# Altium project Grantiot.PrjPcb (part 1 of 2)
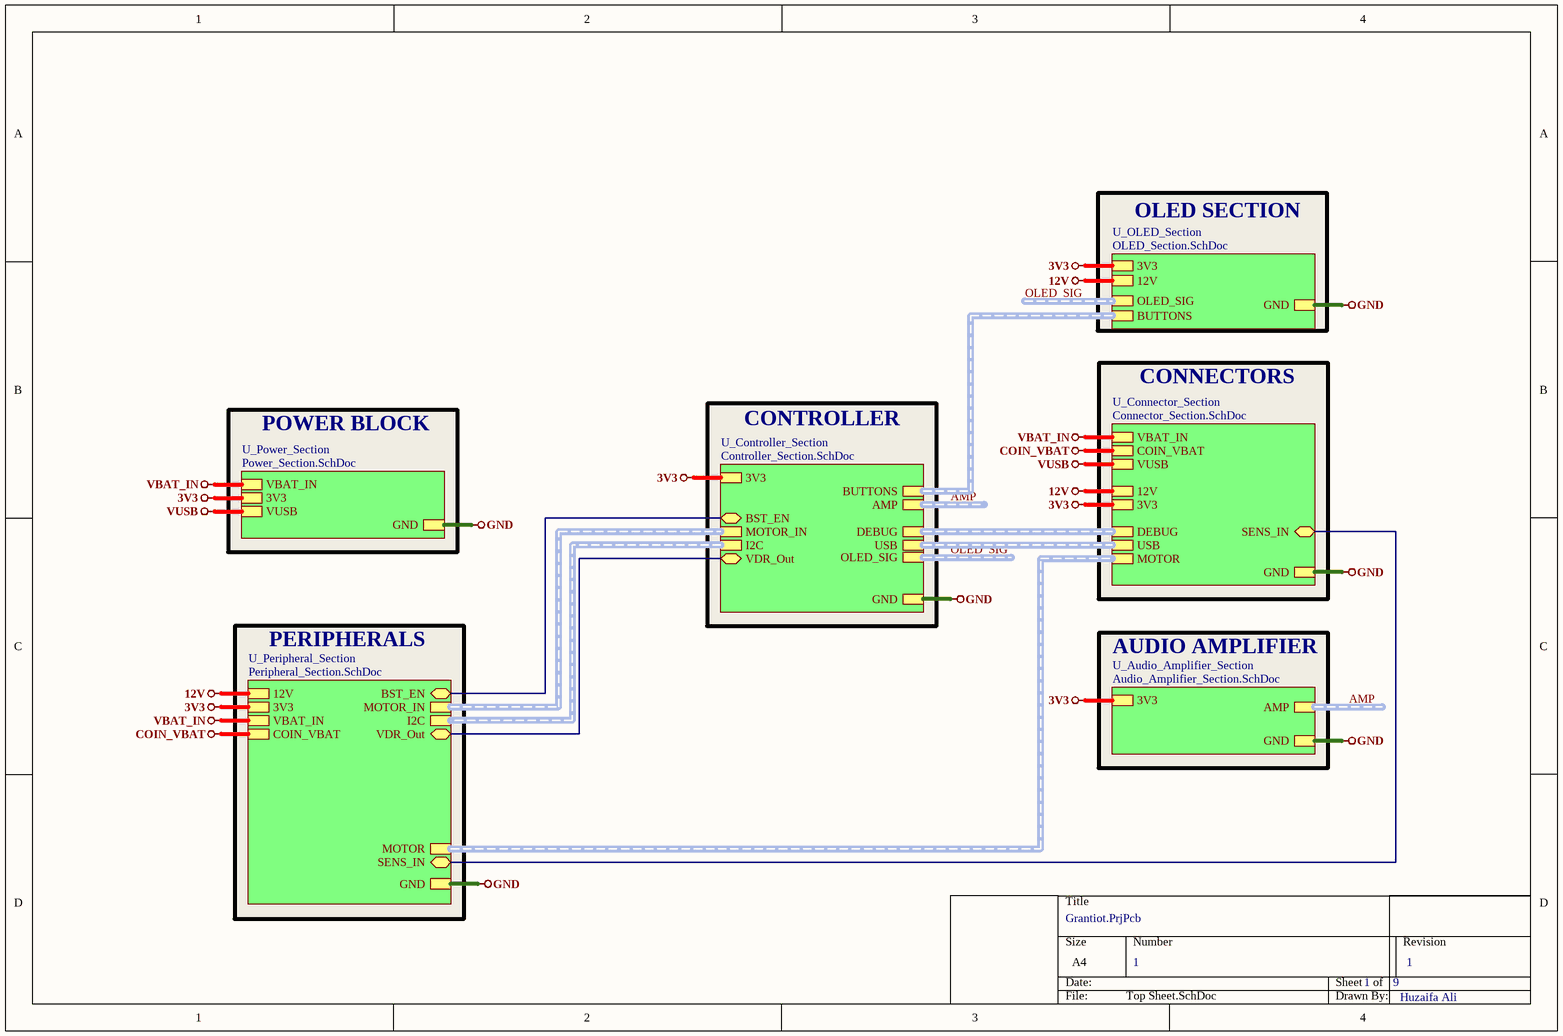
[diagram p0: Top Sheet.SchDoc]
7 sheets, 97 parts. Net scope: hierarchical (ports join the sheet entries above them; power ports are global).
Board file: Grantv3.PcbDoc
Sheets:
  Top Sheet.SchDoc
    U_Power_Section = Power_Section.SchDoc
    U_Peripheral_Section = Peripheral_Section.SchDoc
    U_Controller_Section = Controller_Section.SchDoc
    U_Connector_Section = Connector_Section.SchDoc
    U_Audio_Amplifier_Section = Audio_Amplifier_Section.SchDoc
    U_OLED_Section = OLED_Section.SchDoc

## Sheet Top Sheet.SchDoc
size A4; DocumentNumber: 1; SheetNumber: 1; SheetTotal: 9

### Sub-sheets
U_Audio_Amplifier_Section = Audio_Amplifier_Section.SchDoc: 3V3, GND, AMP (harness AMP)
U_Connector_Section = Connector_Section.SchDoc: SENS_IN (bidir), DEBUG (harness DEBUG), USB (harness USB), MOTOR (harness MOTOR), 12V, 3V3, GND, VBAT_IN, COIN_VBAT, VUSB
U_Controller_Section = Controller_Section.SchDoc: VDR_Out (bidir), USB (harness USB), DEBUG (harness DEBUG), I2C (harness I2C), MOTOR_IN (harness MOTOR_IN), 3V3, GND, BST_EN (bidir), AMP (harness AMP), OLED_SIG (harness OLED_SIG), BUTTONS (harness BUTTONS)
U_OLED_Section = OLED_Section.SchDoc: OLED_SIG (harness OLED_SIG), 12V, 3V3, GND, BUTTONS (harness BUTTONS)
U_Peripheral_Section = Peripheral_Section.SchDoc: BST_EN (bidir), SENS_IN (bidir), VDR_Out (bidir), MOTOR (harness MOTOR), I2C (harness I2C), MOTOR_IN (harness MOTOR_IN), 12V, 3V3, GND, VBAT_IN, COIN_VBAT
U_Power_Section = Power_Section.SchDoc: VBAT_IN, 3V3, GND, VUSB

### Nets
3V3: sheet U_Power_Section/3V3, sheet U_Peripheral_Section/3V3, sheet U_Controller_Section/3V3, sheet U_Connector_Section/3V3, sheet U_Audio_Amplifier_Section/3V3, sheet U_OLED_Section/3V3
12V: sheet U_Peripheral_Section/12V, sheet U_Connector_Section/12V, sheet U_OLED_Section/12V
COIN_VBAT: sheet U_Peripheral_Section/COIN_VBAT, sheet U_Connector_Section/COIN_VBAT
GND: sheet U_Power_Section/GND, sheet U_Peripheral_Section/GND, sheet U_Controller_Section/GND, sheet U_Connector_Section/GND, sheet U_Audio_Amplifier_Section/GND, sheet U_OLED_Section/GND
VBAT_IN: sheet U_Power_Section/VBAT_IN, sheet U_Peripheral_Section/VBAT_IN, sheet U_Connector_Section/VBAT_IN  [project net 3V3ZD]
VUSB: sheet U_Power_Section/VUSB, sheet U_Connector_Section/VUSB  [project net VSUB]
BST_EN: sheet U_Peripheral_Section/BST_EN, sheet U_Controller_Section/BST_EN
SENS_IN: sheet U_Peripheral_Section/SENS_IN, sheet U_Connector_Section/SENS_IN
VDR_Out: sheet U_Peripheral_Section/VDR_Out, sheet U_Controller_Section/VDR_Out

### Buses and harness runs
harness AMP = sheet U_Audio_Amplifier_Section/AMP
harness AMP = sheet U_Controller_Section/AMP
harness OLED_SIG = sheet U_Controller_Section/OLED_SIG
harness OLED_SIG = sheet U_OLED_Section/OLED_SIG
harness sheet U_Connector_Section/DEBUG = sheet U_Controller_Section/DEBUG
harness sheet U_Connector_Section/MOTOR = sheet U_Peripheral_Section/MOTOR
harness sheet U_Connector_Section/USB = sheet U_Controller_Section/USB
harness sheet U_Controller_Section/BUTTONS = sheet U_OLED_Section/BUTTONS
harness sheet U_Controller_Section/I2C = sheet U_Peripheral_Section/I2C
harness sheet U_Controller_Section/MOTOR_IN = sheet U_Peripheral_Section/MOTOR_IN

### Notes on the sheet
- OLED SECTION
- CONNECTORS
- POWER BLOCK
- CONTROLLER
- PERIPHERALS
- AUDIO AMPLIFIER
- 1
- Huzaifa Ali

## Sheet Power_Section.SchDoc
size A4; DocumentNumber: 2; SheetNumber: 2; SheetTotal: 9
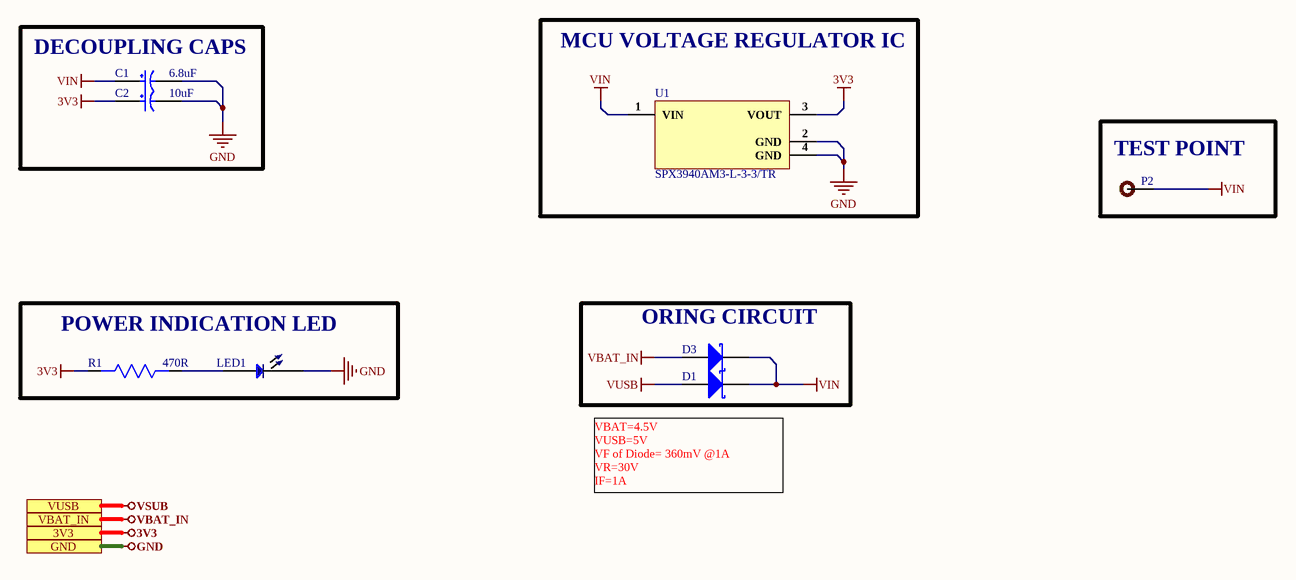
[diagram p1: Power_Section.SchDoc]

### Parts
C1  6.8uF  [EEEHB1E6R8R]
C2  10uF  [RVT1E100M0405]
D1  PMEG3010ER,115  [SOD123W]  (value not drawn)
D3  PMEG3010ER,115  [SOD123W]  (value not drawn)
LED1  TJ-S1005SW4TGLC2R-A5  [LED 0402]  (value not drawn)
P2  TEST POINT  [TEST POINT]  (value not drawn)
R1  470R  [Res0402]
U1  SPX3940AM3-L-3-3/TR  [SPX3940AM3-L-3-3/TR]

### Blocks framed on the sheet
DECOUPLING CAPS: C1 C2
MCU VOLTAGE REGULATOR IC: U1
TEST POINT: P2
POWER INDICATION LED: LED1 R1
ORING CIRCUIT: D1 D3

### Ports
3V3, GND, VBAT_IN, VUSB

### Nets
3V3: C2.1 R1.2 U1.3(VOUT) ; port 3V3
GND: C1.2 C2.2 LED1.2 U1.2(GND) U1.4(GND) ; port GND
VBAT_IN: D3.A ; port VBAT_IN  [project net 3V3ZD]
VIN: C1.1 D1.K D3.K P2.1 U1.1(VIN)
VSUB: D1.A ; port VUSB  [also labelled VUSB]
NetLED1_1: LED1.1 R1.1

### Notes on the sheet
- (near D1) VBAT=4.5V
  VUSB=5V
  VF of Diode= 360mV @1A
  VR=30V
  IF=1A
- 1
- Huzaifa Ali

### Library data of the parts
C1 = EEEHB1E6R8R: CAP ALUM 6.8UF 20% 25V SMD; Manufacturer: Panasonic; Manufacturer Part Number: EEE-HB1E6R8R; Ripple Current: 25mA; Polarity: Polar; Life (Hours): 2000Hour; Leakage Current: 3uA; Supplier 1: Digi-Key; RoHS: Yes; Category: Aluminum Electrolytic Capacitors; Stock 1: 1546; Pricing 1: 1=0.43000, 10=0.29300, 50=0.19560, 100=0.16620, 500=0.11730, 1000=0.10264 (USD); Mount: Surface Mount,PCB; Case/Package: Radial; Min Operating Temperature: -40°C; Max Operating Temperature: 105°C; Capacitance: 6.8uF; Tolerance: 20%; Voltage Rating: 25V; Ripple Current (AC): 25mA; Packaging: Tape and Reel; Voltage Rating (DC): 25V; Package Quantity: 2000; Termination: SMD/SMT; Voltage: 25V; Series: HB; Construction: Cylindrical; Diameter: 4mm; Length: 5.5mm; Width: 650um; Height: 5.8mm; Height - Seated (Max): 0.228inch; Radiation Hardening: No; REACH SVHC: Unknown; Lead Free: Lead Free; RoHS Compliant: Yes; ComponentLink1URL: https://datasheet.ciiva.com/11784/0900766b806bc524-11784635.pdf?src-supplier=RSComponents; ComponentLink1Description: https://datasheet.ciiva.com/11784/0900766b806bc524-11784635.pdf?src-supplier=RSComponents; ComponentLink2URL: https://datasheet.ciiva.com/7903/1790623-7903207.pdf?src-supplier=Element14; ComponentLink2Description: https://datasheet.ciiva.com/7903/1790623-7903207.pdf?src-supplier=Element14; ComponentLink3URL: https://datasheet.ciiva.com/14592/70068251-14592830.pdf?src-supplier=Allied+Electronics; ComponentLink3Description: https://datasheet.ciiva.com/14592/70068251-14592830.pdf?src-supplier=Allied+Electronics; ComponentLink4URL: https://datasheet.ciiva.com/14596/70068251-14596488.pdf?src-supplier=Allied+Electronics; ComponentLink4Description: https://datasheet.ciiva.com/14596/70068251-14596488.pdf?src-supplier=Allied+Electronics; ComponentLink5URL: https://datasheet.ciiva.com/11681/aba0000ce4-11681133.pdf?src-supplier=Avnet; ComponentLink5Description: https://datasheet.ciiva.com/11681/aba0000ce4-11681133.pdf?src-supplier=Avnet; ComponentLink6URL: https://datasheet.ciiva.com/30226/16aba0000ce4-30226095.pdf?src-supplier=Onlinecomponents.com; ComponentLink6Description: https://datasheet.ciiva.com/30226/16aba0000ce4-30226095.pdf?src-supplier=Onlinecomponents.com; Supplier Part Number 1: PCE4142CT-ND
C2 = RVT1E100M0405: CAP ALUM 10uF 25V SMD; Manufacturer: ROQANG; φD: 4mm; L: 5.4mm; Tolerance: ±20%; Operating Temperature: -45℃~+105℃; Rated Voltage: 25V; Capacitance: 10uF
D1 D3 = PMEG3010ER,115: DIODE SCHOTTKY 30V 1A SOD123W; Manufacturer: Nexperia; Supplier 1: Digi-Key; Manufacturer Part Number: PMEG3010ER,115; Stock 1: 75070; Pricing 1: 1=0.36, 10=0.29, 100=0.1669, 500=0.1545, 1000=0.10506 (USD); Supplier Part Number 1: 1727-5201-1-ND
LED1 = TJ-S1005SW4TGLC2R-A5: Red 625nm 0402 Light Emitting Diodes (LED) RoHS; Manufacturer: TOGIALED; Manufacturer Part No: TJ-S1005SW4TGLC2R-A5; Package: 0402
P2 = TEST POINT: Test Point ON
R1 = RTT02471JTH: 470 ±5% 1/16W ±100ppm/°C 0402 Chip Resistor - Surface Mount RoHS; Manufacturer: RALEC; Manufacturer Part No: RTT02471JTH; Package: 0402; Value: 470R
U1 = SPX3940AM3-L-3-3/TR: IC REG LDO 3.3V 1A SOT223; Manufacturer: Exar; Max Input Voltage: 16V; Dropout Voltage: 280mV; Number of Outputs: 1; Min Input Voltage: 3.1V; Polarity: Positive; Quiescent Current: 25mA; Output Voltage Accuracy: 1%; Supplier 1: Mouser; Manufacturer Part Number: SPX3940AM3-L-3-3/TR; RoHS: Yes; Category: Voltage Regulators - Linear; Mount: Surface Mount; Case/Package: SOT-223; Number of Pins: 4; Min Operating Temperature: -40°C; Max Operating Temperature: 125°C; Packaging: Tape and Reel; Output Current: 1A; Max Output Current: 1A; Output Voltage: 3.3V; Min Output Voltage: 3.3V; RoHS Compliant: Yes; Lead Free: Lead Free; ComponentLink1URL: https://datasheet.ciiva.com/2057/spx3940-ds-r100-022912-2057339.pdf?src-supplier=Digi-Key; ComponentLink1Description: https://datasheet.ciiva.com/2057/spx3940-ds-r100-022912-2057339.pdf?src-supplier=Digi-Key; ComponentLink2URL: https://datasheet.ciiva.com/16386/spx3940-series-16386634.pdf?src-supplier=Future+Electronics; ComponentLink2Description: https://datasheet.ciiva.com/16386/spx3940-series-16386634.pdf?src-supplier=Future+Electronics; Supplier Part Number 1: 701-SPX3940AM3-L33TR

## Sheet Peripheral_Section.SchDoc
size A4; DocumentNumber: 6; SheetNumber: 6; SheetTotal: 9
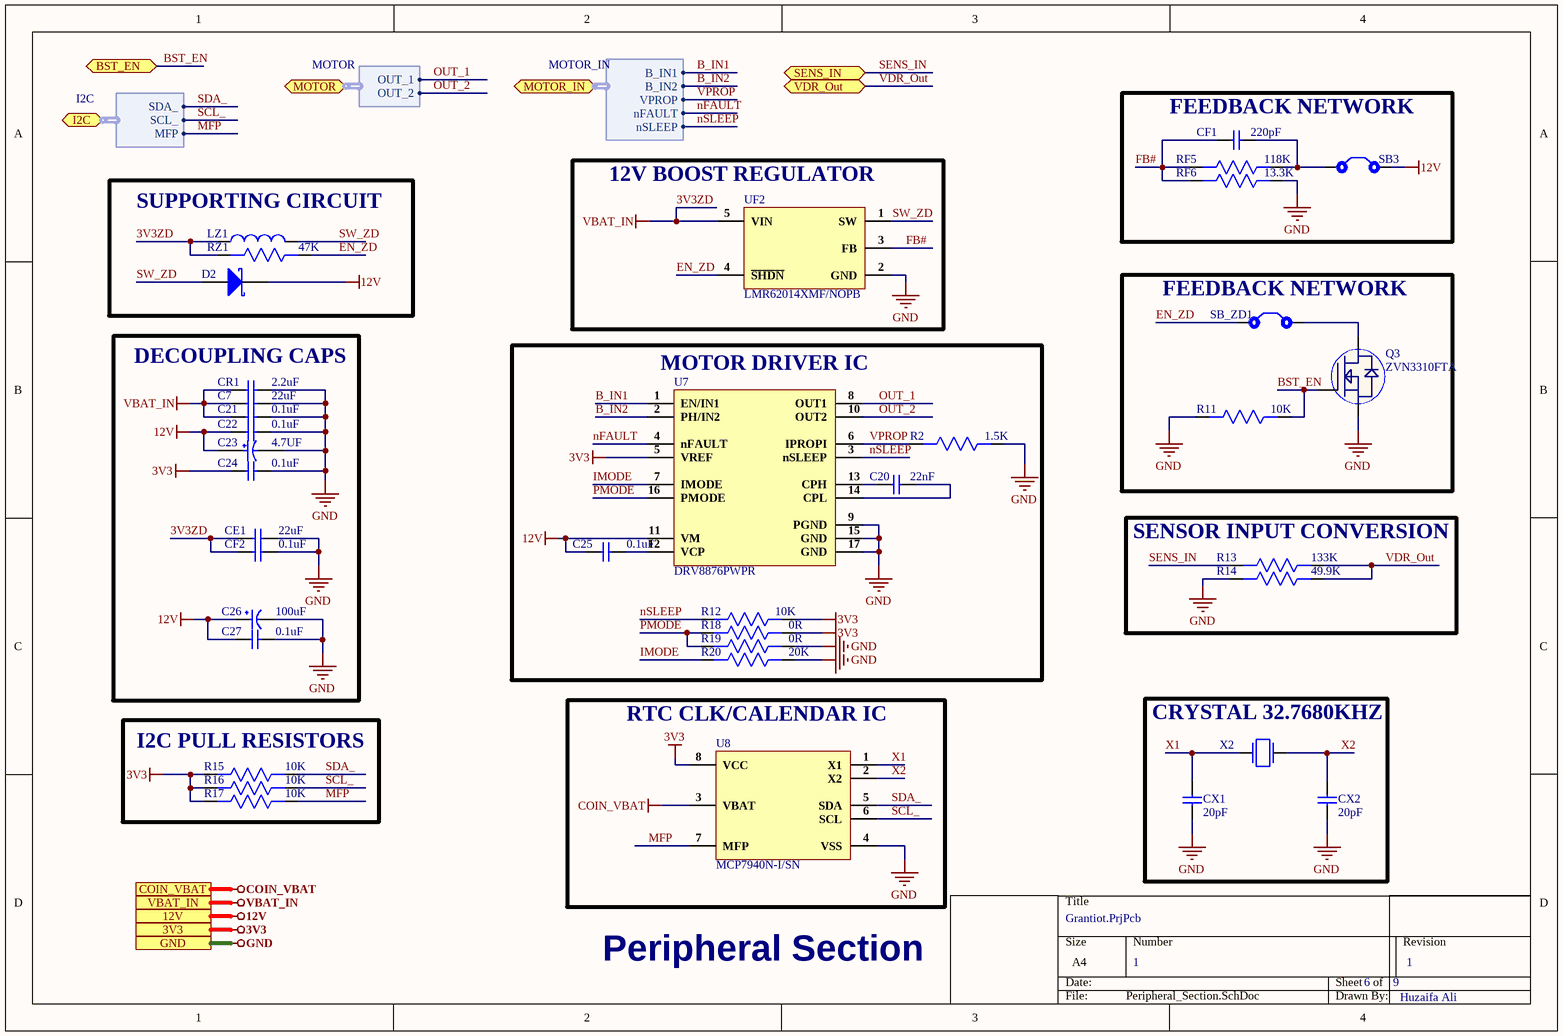
[diagram p2: Peripheral_Section.SchDoc]

### Parts
C7  22uF  [Cap0805]
C20  22nF  [Cap 0603]
C21  0.1uF  [Cap 0402]
C22  0.1uF  [Cap 0402]
C23  4.7UF  [TAJB475K035RNJ]
C24  0.1uF  [Cap 0402]
C25  0.1uF  [Cap 0402]
C26  100uF  [UWX1E101MCL1GB]
C27  0.1uF  [Cap 0402]
CE1  22uF  [Cap0805]
CF1  220pF  [Cap 0402]
CF2  0.1uF  [Cap 0402]
CR1  2.2uF  [Cap 0402]
CX1  20pF  [Cap 0201]
CX2  20pF  [Cap 0201]
D2  RB060M-30TR  [SOD-123F]  (value not drawn)
LZ1  MS0420-100M  [MS0420-100M]  (value not drawn)
Q3  ZVN3310FTA  [SOT23-3]
R2  1.5K  [Res-0201]
R11  10K  [Res0402]
R12  10K  [Res0402]
R13  133K  [Res0402]
R14  49.9K  [Res0402]
R15  10K  [Res0402]
R16  10K  [Res0402]
R17  10K  [Res0402]
R18  0R  [Res0402]
R19  0R  [Res0402]
R20  20K  [Res0402]
RF5  118K  [Res0402]
RF6  13.3K  [Res0402]
RZ1  47K  [Res0402]
SB3  Solder Bridge  [Solder Bridge]  (value not drawn)
SB_ZD1  Solder Bridge  [Solder Bridge]  (value not drawn)
U7  DRV8876PWPR  [16HTSSOP]
U8  MCP7940N-I/SN  [MCP7940N-I/SN]
UF2  LMR62014XMF/NOPB  [SOT23-5]
X2  NX3215SA-32.768K-STD-MUA-8  [NX3215SA-32.768K-STD-MUA-8]  (value not drawn)

### Blocks framed on the sheet
FEEDBACK NETWORK: CF1 RF5 RF6 SB3
SUPPORTING CIRCUIT: D2 LZ1 RZ1
12V BOOST REGULATOR: UF2
FEEDBACK NETWORK: Q3 R11 SB_ZD1
DECOUPLING CAPS: C7 C21-C24 C26 C27 CE1 CF2 CR1
MOTOR DRIVER IC: C20 C25 R2 R12 R18-R20 U7
SENSOR INPUT CONVERSION: R13 R14
I2C PULL RESISTORS: R15-R17
RTC CLK/CALENDAR IC: U8
CRYSTAL 32.7680KHZ: CX1 CX2 X2

### Ports
3V3, 12V, BST_EN (bidir), COIN_VBAT, GND, I2C (bidir, harness I2C), MOTOR (bidir, harness MOTOR), MOTOR_IN (bidir, harness MOTOR_IN), SENS_IN (bidir), VBAT_IN, VDR_Out (bidir)

### Harnesses
MOTOR: OUT_1, OUT_2
I2C: SDA_, SCL_, MFP
MOTOR_IN: B_IN1, B_IN2, VPROP, nFAULT, nSLEEP

### Nets
3V3: C24.1 R12.1 R15.2 R16.2 R17.2 R18.1 U7.5(VREF) U8.8(VCC) ; port 3V3
3V3ZD: C7.1 C21.1 CE1.1 CF2.1 CR1.1 LZ1.1 RZ1.2 UF2.5(VIN) ; port VBAT_IN  [also labelled VBAT_IN]
12V: C22.1 C23.2 C25.1 C26.1 C27.1 D2.K SB3.2 U7.11(VM) ; port 12V
COIN_VBAT: U8.3(VBAT) ; port COIN_VBAT
GND: C7.2 C21.2 C22.2 C23.1 C24.2 C26.2 C27.2 CE1.2 CF2.2 CR1.2 CX1.1 CX2.1 Q3.2(S) R2.1 R11.2 R14.2 R19.1 R20.1 RF6.1 U7.9(PGND) U7.15(GND) U7.17(GND) U8.4(VSS) UF2.2(GND) ; port GND
B_IN1: U7.1(EN/IN1) ; port MOTOR_IN.B_IN1
B_IN2: U7.2(PH/IN2) ; port MOTOR_IN.B_IN2
BST_EN: Q3.1(G) R11.1 ; port BST_EN
EN_ZD: RZ1.1 SB_ZD1.1 UF2.4(~{SHDN})
FB#: CF1.1 RF5.2 RF6.2 UF2.3(FB)
IMODE: R20.2 U7.7(IMODE)
MFP: R17.1 U8.7(MFP) ; port I2C.MFP
nFAULT: U7.4(nFAULT) ; port MOTOR_IN.nFAULT
nSLEEP: R12.2 U7.3(nSLEEP) ; port MOTOR_IN.nSLEEP
OUT_1: U7.8(OUT1) ; port MOTOR.OUT_1
OUT_2: U7.10(OUT2) ; port MOTOR.OUT_2
PMODE: R18.2 R19.2 U7.16(PMODE)
SCL_: R16.1 U8.6(SCL) ; port I2C.SCL_
SDA_: R15.1 U8.5(SDA) ; port I2C.SDA_
SENS_IN: R13.2 ; port SENS_IN
SW_ZD: D2.A LZ1.2 UF2.1(SW)
VDR_Out: R13.1 R14.1 ; port VDR_Out
VPROP: R2.2 U7.6(IPROPI) ; port MOTOR_IN.VPROP
X1: CX1.2 U8.1(X1) X2.2
X2: CX2.2 U8.2(X2) X2.1
NetC20_1: C20.1 U7.13(CPH)
NetC20_2: C20.2 U7.14(CPL)
NetC25_2: C25.2 U7.12(VCP)
NetCF1_2: CF1.2 RF5.1 SB3.1
NetQ3_3: Q3.3(D) SB_ZD1.2

### Notes on the sheet
- Peripheral Section
- 1
- Huzaifa Ali

### Library data of the parts
C7 = GRM21BR61E226ME44L: CAP CER 22UF 25V X5R 0805; Manufacturer: Murata; Material: Ceramic; Tolerance: 20%; Supplier 1: Digi-Key; Manufacturer Part Number: GRM21BR61E226ME44L; Stock 1: 469852; Pricing 1: 1=0.54, 10=0.383, 100=0.2521, 500=0.18672, 1000=0.15871 (USD); Mount: Surface Mount; Case/Package: 0805; Weight: 0.000335oz; Case Code (Metric): 2012; Case Code (Imperial): 0805; Min Operating Temperature: -55°C; Max Operating Temperature: 85°C; Capacitance: 22uF; Voltage Rating: 25V; Packaging: Tape and Reel; Dielectric: X5R; Voltage: 25V; Termination: SMD/SMT; Composition: Ceramic; Voltage Rating (DC): 25V; Package Quantity: 3000; Length: 2mm; Height: 1.25mm; Width: 1.25mm; Thickness: 0.057inch; Depth: 1.25mm; REACH SVHC: No SVHC; Lead Free: Lead Free; ComponentLink1URL: http://www.farnell.com/datasheets/2048737.pdf?src-supplier=Farnell; ComponentLink1Description: http://www.farnell.com/datasheets/2048737.pdf?src-supplier=Farnell; ComponentLink2URL: http://www.farnell.com/datasheets/2048737.pdf?src-supplier=Element14; ComponentLink2Description: http://www.farnell.com/datasheets/2048737.pdf?src-supplier=Element14; Supplier Part Number 1: 490-10749-1-ND
C20 = CGA3E2X7R2A223K080AA: CAP CER 0.022UF 100V X7R 0603; Manufacturer: TDK; Tolerance: 10%; Supplier 1: Digi-Key; Manufacturer Part Number: CGA3E2X7R2A223K080AA; RoHS: Yes; Category: Ceramic Capacitors; Stock 1: 56079; Pricing 1: 1=0.11000, 10=0.07600, 50=0.04340, 100=0.03590, 500=0.02516, 1000=0.02083 (USD); Mount: Surface Mount; Case/Package: 0603; Case Code (Metric): 1608; Case Code (Imperial): 0603; Weight: 7.1E-05oz; Min Operating Temperature: -55°C; Max Operating Temperature: 125°C; Capacitance: 22nF; Voltage Rating: 100V; Packaging: Tape and Reel; Voltage Rating (DC): 100V; Dielectric: X7R; Termination: SMD/SMT; Series: CGA; Package Quantity: 1; Resistor Type: Ceramic; Length: 1.6mm; Width: 0.031inch; Height: 0.8mm; Thickness: 0.035inch; Depth: 0.8mm; Ratings: AEC-Q200; RoHS Compliant: Yes; REACH SVHC: No SVHC; ComponentLink1URL: https://datasheet.ciiva.com/22725/1735406-22725648.pdf?src-supplier=Element14; ComponentLink1Description: https://datasheet.ciiva.com/22725/1735406-22725648.pdf?src-supplier=Element14; ComponentLink2URL: https://datasheet.ciiva.com/24218/cga3e2x7r2a223k080aa-266292-24218959.pdf?src-supplier=Mouser; ComponentLink2Description: https://datasheet.ciiva.com/24218/cga3e2x7r2a223k080aa-266292-24218959.pdf?src-supplier=Mouser; ComponentLink3URL: https://datasheet.ciiva.com/7975/1807242-7975349.pdf?src-supplier=Element14; ComponentLink3Description: https://datasheet.ciiva.com/7975/1807242-7975349.pdf?src-supplier=Element14; Supplier Part Number 1: 445-5814-1-ND
C21 C22 C24 C25 C27 CF2 = CC0402KRX7R7BB104: CAP CER 0.1UF 16V X7R 0402; Manufacturer: Yageo; Tolerance: 10%; Capacitance: 100nF; Supplier 1: Digi-Key; Manufacturer Part Number: CC0402KRX7R7BB104; Stock 1: 16982736; Pricing 1: 1=0.1, 10=0.034, 100=0.015, 500=0.0107, 1000=0.00841, 2500=0.00764, 5000=0.00703 (USD); Mount: Surface Mount; Case/Package: 0402; Number of Pins: 2; Case Code (Metric): 1005; Case Code (Imperial): 0402; Min Operating Temperature: -55°C; Max Operating Temperature: 125°C; Dielectric: X7R; Voltage Rating: 16V; Voltage Rating (DC): 16V; Packaging: Tape and Reel; Package Quantity: 1; Termination: SMD/SMT; Composition: Ceramic; Voltage: 16V; Length: 1mm; Height: 0.5mm; Width: 0.02inch; Thickness: 0.022inch; Depth: 0.5mm; Radiation Hardening: No; REACH SVHC: No SVHC; Lead Free: Lead Free; Halogen Free: Halogen Free; ComponentLink1URL: http://www.yageo.com/documents/recent/UPY-GPHC_X7R_6.3V-to-50V_8.pdf?src-supplier=Avnet+Europe; ComponentLink1Description: http://www.yageo.com/documents/recent/UPY-GPHC_X7R_6.3V-to-50V_8.pdf?src-supplier=Avnet+Europe; ComponentLink2URL: http://www.yageo.com/documents/recent/UPY-GPHC_X7R_6.3V-to-50V_18.pdf?src-supplier=Digi-Key; ComponentLink2Description: http://www.yageo.com/documents/recent/UPY-GPHC_X7R_6.3V-to-50V_18.pdf?src-supplier=Digi-Key; ComponentLink3URL: http://www.yageo.com/documents/recent/UPY-GPHC_X7R_6.3V-to-50V_8.pdf?src-supplier=Avnet; ComponentLink3Description: http://www.yageo.com/documents/recent/UPY-GPHC_X7R_6.3V-to-50V_8.pdf?src-supplier=Avnet; ComponentLink4URL: http://www.yageo.com/documents/recent/UPY-GPHC_X7R_6.3V-to-50V_18.pdf?src-supplier=Mouser; ComponentLink4Description: http://www.yageo.com/documents/recent/UPY-GPHC_X7R_6.3V-to-50V_18.pdf?src-supplier=Mouser; ComponentLink5URL: http://www.farnell.com/datasheets/2167236.pdf?src-supplier=Element14; ComponentLink5Description: http://www.farnell.com/datasheets/2167236.pdf?src-supplier=Element14; ComponentLink6URL: http://www.farnell.com/datasheets/1489800.pdf?src-supplier=Element14; ComponentLink6Description: http://www.farnell.com/datasheets/1489800.pdf?src-supplier=Element14; Supplier Part Number 1: 311-1338-1-ND
C23 = TAJB475K035RNJ: CAP TANT 4.7UF 10% 35V 1411; Manufacturer: Kyocera AVX; Dielectric Material: Tantalum; Tolerance: 20%; ESR (Equivalent Series Resistance): 3.1R; Leakage Current: 1.6uA; Polarity: Polar; Dissipation Factor: 6%; Supplier 1: Digi-Key; Manufacturer Part Number: TAJB475K035RNJ; Stock 1: 3949; Pricing 1: 1=0.71, 10=0.505, 100=0.3322, 500=0.2461, 1000=0.20919 (USD); Mount: Surface Mount,PCB; Case/Package: 1210; Number of Pins: 2; Weight: 0.000564oz; Case Code (Imperial): 1210; Case Code (Metric): 3528; Min Operating Temperature: -55°C; Max Operating Temperature: 125°C; Capacitance: 4.7uF; Voltage Rating: 35V; Packaging: Tape and Reel; Package Quantity: 1; Voltage Rating (DC): 35V; Termination: SMD/SMT; Voltage: 35V; Features: General Purpose; Length: 3.5mm; Height: 1.9mm; Depth: 2.8mm; Width: 2.8mm; Height - Seated (Max): 0.083inch; Radiation Hardening: No; REACH SVHC: No SVHC; Lead Free: Lead Free; ComponentLink1URL: http://uk.rs-online.com/webdocs/0ccd/0900766b80ccdc61.pdf?src-supplier=RSComponents; ComponentLink1Description: http://uk.rs-online.com/webdocs/0ccd/0900766b80ccdc61.pdf?src-supplier=RSComponents; ComponentLink2URL: http://www.farnell.com/datasheets/1826076.pdf?src-supplier=Element14; ComponentLink2Description: http://www.farnell.com/datasheets/1826076.pdf?src-supplier=Element14; ComponentLink3URL: http://datasheets.avx.com/TAJ.pdf?src-supplier=Digi-Key; ComponentLink3Description: http://datasheets.avx.com/TAJ.pdf?src-supplier=Digi-Key; ComponentLink4URL: http://www.avx.com/docs/Catalogs/taj.pdf?src-supplier=Farnell; ComponentLink4Description: http://www.avx.com/docs/Catalogs/taj.pdf?src-supplier=Farnell; ComponentLink5URL: https://www.alliedelec.com/m/d/9166fb755e7ffffad4c533f86d810ce4.pdf?src-supplier=Allied+Electronics; ComponentLink5Description: https://www.alliedelec.com/m/d/9166fb755e7ffffad4c533f86d810ce4.pdf?src-supplier=Allied+Electronics; ComponentLink6URL: https://www.distrelec.biz/Web/Downloads/_e/ng/taj_ENG.pdf?mime=application%2Fpdf&src-supplier=Distrelec; ComponentLink6Description: https://www.distrelec.biz/Web/Downloads/_e/ng/taj_ENG.pdf?mime=application%2Fpdf&src-supplier=Distrelec; ComponentLink7URL: http://www.avx.com/docs/catalogs/taj.pdf?src-supplier=Avnet+Europe; ComponentLink7Description: http://www.avx.com/docs/catalogs/taj.pdf?src-supplier=Avnet+Europe; ComponentLink8URL: http://www.avx.com/docs/catalogs/taj.pdf?src-supplier=Avnet; ComponentLink8Description: http://www.avx.com/docs/catalogs/taj.pdf?src-supplier=Avnet; ComponentLink9URL: http://www.avxcorp.com/docs/Catalogs/taj.pdf?src-supplier=Future+Electronics; ComponentLink9Description: http://www.avxcorp.com/docs/Catalogs/taj.pdf?src-supplier=Future+Electronics; ComponentLink10URL: http://www.mouser.com/ds/2/40/taj-776811.pdf?src-supplier=Mouser; ComponentLink10Description: http://www.mouser.com/ds/2/40/taj-776811.pdf?src-supplier=Mouser; ComponentLink11URL: https://www.verical.com/server-webapp/html/getDatasheet?partID=149140&src-supplier=Verical; ComponentLink11Description: https://www.verical.com/server-webapp/html/getDatasheet?partID=149140&src-supplier=Verical; Supplier Part Number 1: 478-1691-1-ND
C26 = UWX1E101MCL1GB: CAP ALUM 100UF 20% 25V SMD; Manufacturer: Nichicon; Dielectric Material: Aluminium; Ripple Current: 110mA; Polarity: Polar; Leakage Current: 3uA; Life (Hours): 2000Hour; Dissipation Factor: 0.14%; Lead Diameter: 0.8mm; Supplier 1: Digi-Key; Manufacturer Part Number: UWX1E101MCL1GB; Stock 1: 30613; Pricing 1: 1=0.43, 10=0.301, 50=0.211, 100=0.1808, 500=0.13558 (USD); Mount: Surface Mount; Case/Package: Radial; Number of Pins: 2; Weight: 0.01lb; Min Operating Temperature: -40°C; Max Operating Temperature: 85°C; Capacitance: 100uF; Tolerance: 20%; Ripple Current (AC): 110mA; Voltage Rating: 25V; Packaging: Tape and Reel; Package Quantity: 1000; Voltage Rating (DC): 25V; Termination: SMD/SMT; Voltage: 25V; Series: WX; Construction: Cylindrical; Diameter: 8mm; Length: 5.4mm; Width: 0.25inch; Height: 5.4mm; Lead Pitch: 2.3mm; Height - Seated (Max): 0.213inch; Radiation Hardening: No; REACH SVHC: No SVHC; Lead Free: Lead Free; RoHS Compliant: Yes; ComponentLink1URL: http://nichicon-us.com/english/products/pdfs/e-uwx.pdf?src-supplier=Digi-Key; ComponentLink1Description: http://nichicon-us.com/english/products/pdfs/e-uwx.pdf?src-supplier=Digi-Key; ComponentLink2URL: http://www.nichicon.co.jp/english/products/pdfs/e-ch_ref.pdf?src-supplier=Mouser; ComponentLink2Description: http://www.nichicon.co.jp/english/products/pdfs/e-ch_ref.pdf?src-supplier=Mouser; ComponentLink3URL: http://www.nichicon.co.jp/english/products/pdfs/e-wx.pdf?src-supplier=Avnet; ComponentLink3Description: http://www.nichicon.co.jp/english/products/pdfs/e-wx.pdf?src-supplier=Avnet; ComponentLink4URL: http://uk.rs-online.com/webdocs/0fa3/0900766b80fa3a90.pdf?src-supplier=RSComponents; ComponentLink4Description: http://uk.rs-online.com/webdocs/0fa3/0900766b80fa3a90.pdf?src-supplier=RSComponents; ComponentLink5URL: http://nichicon-us.com/english/products/pdfs/e-wx.pdf?src-supplier=Future+Electronics; ComponentLink5Description: http://nichicon-us.com/english/products/pdfs/e-wx.pdf?src-supplier=Future+Electronics; ComponentLink6URL: http://www.nichicon.co.jp/english/products/pdfs/e-ch_ref.pdf?src-supplier=Avnet+Europe; ComponentLink6Description: http://www.nichicon.co.jp/english/products/pdfs/e-ch_ref.pdf?src-supplier=Avnet+Europe; ComponentLink7URL: http://www.farnell.com/datasheets/2364658.pdf?src-supplier=Element14; ComponentLink7Description: http://www.farnell.com/datasheets/2364658.pdf?src-supplier=Element14; Supplier Part Number 1: 493-2113-6-ND; Supplier 2: Digi-Key; RoHS: Yes; Category: Aluminum Electrolytic Capacitors; Stock 2: 25010; Pricing 2: 1=0.43000, 10=0.30100, 50=0.21100, 100=0.18080, 500=0.13558 (USD); ComponentLink8URL: https://datasheet.ciiva.com/11778/0900766b80fa3a90-11778418.pdf?src-supplier=RSComponents; ComponentLink8Description: https://datasheet.ciiva.com/11778/0900766b80fa3a90-11778418.pdf?src-supplier=RSComponents; ComponentLink9URL: https://datasheet.ciiva.com/17527/e-wx-17527624.pdf?src-supplier=Avnet+Europe; ComponentLink9Description: https://datasheet.ciiva.com/17527/e-wx-17527624.pdf?src-supplier=Avnet+Europe; ComponentLink10URL: https://datasheet.ciiva.com/5361/e-wx-11809-5361100.pdf?src-supplier=Mouser; ComponentLink10Description: https://datasheet.ciiva.com/5361/e-wx-11809-5361100.pdf?src-supplier=Mouser; ComponentLink11URL: https://datasheet.ciiva.com/28458/1912851-28458684.pdf?src-supplier=Element14; ComponentLink11Description: https://datasheet.ciiva.com/28458/1912851-28458684.pdf?src-supplier=Element14; ComponentLink12URL: https://datasheet.ciiva.com/96/e-wx-96650.pdf?src-supplier=Digi-Key; ComponentLink12Description: https://datasheet.ciiva.com/96/e-wx-96650.pdf?src-supplier=Digi-Key; ComponentLink13URL: https://datasheet.ciiva.com/96/e-wx-96651.pdf?src-supplier=Digi-Key; ComponentLink13Description: https://datasheet.ciiva.com/96/e-wx-96651.pdf?src-supplier=Digi-Key; ComponentLink14URL: https://datasheet.ciiva.com/96/e-wx-96652.pdf?src-supplier=Digi-Key; ComponentLink14Description: https://datasheet.ciiva.com/96/e-wx-96652.pdf?src-supplier=Digi-Key; ComponentLink15URL: https://datasheet.ciiva.com/11687/e-wx-11687148.pdf?src-supplier=Avnet; ComponentLink15Description: https://datasheet.ciiva.com/11687/e-wx-11687148.pdf?src-supplier=Avnet; ComponentLink16URL: https://datasheet.ciiva.com/16512/e-wx-16512638.pdf?src-supplier=Future+Electronics; ComponentLink16Description: https://datasheet.ciiva.com/16512/e-wx-16512638.pdf?src-supplier=Future+Electronics; Supplier Part Number 2: 493-2113-1-ND
CE1 = GRM21BR61E226ME44L: CAP CER 22UF 25V X5R 0805; Manufacturer: Murata; Tolerance: 20%; Supplier 1: Digi-Key; Manufacturer Part Number: GRM21BR61E226ME44L; Stock 1: 469852; Pricing 1: 1=0.54, 10=0.383, 100=0.2521, 500=0.18672, 1000=0.15871 (USD); Mount: Surface Mount; Case/Package: 0805; Weight: 0.000335oz; Case Code (Metric): 2012; Case Code (Imperial): 0805; Material: Ceramic; Min Operating Temperature: -55°C; Max Operating Temperature: 85°C; Capacitance: 22uF; Voltage Rating: 25V; Packaging: Tape and Reel; Dielectric: X5R; Voltage: 25V; Termination: SMD/SMT; Composition: Ceramic; Voltage Rating (DC): 25V; Package Quantity: 3000; Length: 2mm; Height: 1.25mm; Width: 1.25mm; Thickness: 0.057inch; Depth: 1.25mm; REACH SVHC: No SVHC; Lead Free: Lead Free; ComponentLink1URL: http://www.farnell.com/datasheets/2048737.pdf?src-supplier=Farnell; ComponentLink1Description: http://www.farnell.com/datasheets/2048737.pdf?src-supplier=Farnell; ComponentLink2URL: http://www.farnell.com/datasheets/2048737.pdf?src-supplier=Element14; ComponentLink2Description: http://www.farnell.com/datasheets/2048737.pdf?src-supplier=Element14; Supplier Part Number 1: 490-10749-1-ND
CF1 = CC0402JRNPO9BN221: CAP CER 220PF 50V C0G/NPO 0402; Manufacturer: Yageo; Dielectric Material: Ceramic; Tolerance: 10%; Dielectric: C0G; Temperature Coefficient: 30ppm/°C; Insulation Resistance: 10GR; Dissipation Factor: 0.1%; Supplier 1: Digi-Key; Manufacturer Part Number: CC0402JRNPO9BN221; Stock 1: 97268; Pricing 1: 1=0.1, 10=0.039, 100=0.0172, 500=0.01228, 1000=0.00965, 2500=0.00877, 5000=0.00807 (USD); Mount: Surface Mount; Case/Package: 0402; Number of Pins: 2; Case Code (Metric): 1005; Case Code (Imperial): 0402; Min Operating Temperature: -55°C; Max Operating Temperature: 125°C; Capacitance: 220pF; Package Quantity: 1; Voltage Rating: 50V; Packaging: Tape and Reel; Termination: SMD/SMT; Voltage: 50V; Length: 1mm; Height: 0.5mm; Width: 0.02inch; Thickness: 0.022inch; Depth: 0.5mm; Radiation Hardening: No; REACH SVHC: No SVHC; Lead Free: Lead Free; ComponentLink1URL: http://www.yageo.com/documents/recent/UPY-GP_NP0_16V-to-50V_16.pdf?src-supplier=Digi-Key; ComponentLink1Description: http://www.yageo.com/documents/recent/UPY-GP_NP0_16V-to-50V_16.pdf?src-supplier=Digi-Key; ComponentLink2URL: http://www.yageo.com/documents/recent/UPY-GP_NP0_16V-to-50V_8.pdf?src-supplier=Avnet+Europe; ComponentLink2Description: http://www.yageo.com/documents/recent/UPY-GP_NP0_16V-to-50V_8.pdf?src-supplier=Avnet+Europe; ComponentLink3URL: http://www.farnell.com/datasheets/1132289.pdf?src-supplier=Element14; ComponentLink3Description: http://www.farnell.com/datasheets/1132289.pdf?src-supplier=Element14; ComponentLink4URL: http://www.farnell.com/datasheets/2213336.pdf?src-supplier=Element14; ComponentLink4Description: http://www.farnell.com/datasheets/2213336.pdf?src-supplier=Element14; Supplier Part Number 1: 311-1416-1-ND
CR1 = EMK105ABJ225KV-F: CAP CER 2.2UF 16V X5R 0402; Manufacturer: Taiyo Yuden; Tolerance: 10%; Supplier 1: Digi-Key; Manufacturer Part Number: EMK105ABJ225KV-F; Stock 1: 755; Pricing 1: 1=0.2, 10=0.139, 100=0.0706, 500=0.04834, 1000=0.04276, 2500=0.0409, 5000=0.03718 (USD); Mount: Surface Mount; Case/Package: 0402; Case Code (Imperial): 0402; Case Code (Metric): 1005; Min Operating Temperature: -55°C; Max Operating Temperature: 85°C; Packaging: Tape and Reel; Capacitance: 2.2uF; Voltage Rating: 16V; Lead Free: Lead Free; ComponentLink1URL: http://ds.yuden.co.jp/TYCOMPAS/ut/detail.do?productNo=EMK105ABJ225KV-F&amp;fileName=EMK105ABJ225KV-F_SS&amp;mode=specSheetDownload&src-supplier=Digi-Key; ComponentLink1Description: http://ds.yuden.co.jp/TYCOMPAS/ut/detail.do?productNo=EMK105ABJ225KV-F&amp;fileName=EMK105ABJ225KV-F_SS&amp;mode=specSheetDownload&src-supplier=Digi-Key; ComponentLink2URL: https://ds.yuden.co.jp/TYCOMPAS/ut/detail?pn=EMK105ABJ225KV-F &amp;u=M&src-supplier=Digi-Key; ComponentLink2Description: https://ds.yuden.co.jp/TYCOMPAS/ut/detail?pn=EMK105ABJ225KV-F &amp;u=M&src-supplier=Digi-Key; Supplier Part Number 1: 587-6002-1-ND
CX1 CX2 = GJM0336C1E200JB01D: CAP CER 20PF 25V C0H 0201; Manufacturer: Murata; Tolerance: 5%; Supplier 1: Digi-Key; Manufacturer Part Number: GJM0336C1E200JB01D; Stock 1: 13650; Pricing 1: 1=0.1, 10=0.074, 100=0.0329, 500=0.02348, 1000=0.01845, 2500=0.01678, 5000=0.01543 (USD); Mount: Surface Mount; Case/Package: 0201; Case Code (Metric): 0603; Case Code (Imperial): 0201; Min Operating Temperature: -55°C; Max Operating Temperature: 125°C; Capacitance: 20pF; Voltage Rating: 25V; Packaging: Tape and Reel; Termination: SMD/SMT; Voltage Rating (DC): 25V; Length: 0.024inch; Width: 0.012inch; Thickness: 0.013inch; Lead Free: Lead Free; ComponentLink1URL: http://www.mouser.com/ds/2/281/c02e-2905.pdf?src-supplier=Mouser; ComponentLink1Description: http://www.mouser.com/ds/2/281/c02e-2905.pdf?src-supplier=Mouser; ComponentLink2URL: http://search.murata.co.jp/Ceramy/image/img/A01X/partnumbering_e_01.pdf?src-supplier=Digi-Key; ComponentLink2Description: http://search.murata.co.jp/Ceramy/image/img/A01X/partnumbering_e_01.pdf?src-supplier=Digi-Key; Supplier Part Number 1: 490-13313-1-ND
D2 = RB060M-30TR: DIODE SCHOTTKY 30V 2A PMDU; Manufacturer: Rohm Semiconductor; Manufacture Part no:: RB060M-30TR; ComponentLink1Description: New link; ComponentLink1URL: https://www.digikey.com/en/products/detail/rohm-semiconductor/RB060M-30TR/2336619?s=N4IgTCBcDaIEoCEAMA2JBZAtAZiQFThAF0BfIA
LZ1 = MS0420-100M: 10uH ±20% 1.6A 230mΩ SMD,4.75x4.2x2mm Inductors (SMD) RoHS; Manufacturer: COILMX; Manufacturer Part No: MS0420-100M; Package: Custom; Value: 10uH
Q3 = ZVN3310FTA: MOSFET N-CH 100V .1A SOT23-3; Manufacturer: Diodes Zetex; Rise Time: 5ns; Continuous Drain Current (ID): 100mA; Gate to Source Voltage (Vgs): 20V; Turn-Off Delay Time: 4ns; Turn-On Delay Time: 3ns; Rds On Max: 10R; Input Capacitance: 40pF; Nominal Vgs: 2.4V; Max Power Dissipation: 330mW; Number of Elements: 1; Element Configuration: Single; Supplier 1: Digi-Key; Manufacturer Part Number: ZVN3310FTA; Stock 1: 16974; Pricing 1: 1=0.59, 10=0.517, 25=0.4852, 100=0.3522, 250=0.33972, 500=0.29432, 1000=0.25048 (USD); Mount: Surface Mount; Case/Package: SOT-23; Number of Pins: 3; Weight: 0.000282oz; Min Operating Temperature: -55°C; Max Operating Temperature: 150°C; Package Quantity: 3000; Packaging: Tape and Reel; Dual Supply Voltage: 100V; Drain to Source Voltage (Vdss): 100V; Number of Channels: 1; Drain to Source Breakdown Voltage: 100V; Drain to Source Resistance: 10R; Fall Time: 5ns; On-State Resistance: 10R; Power Dissipation: 330mW; Termination: SMD/SMT; Threshold Voltage: 2.4V; Voltage Rating (DC): 100V; Current Rating: 100mA; Current: 100mA; Voltage: 100V; Length: 3.04mm; Height: 1.02mm; Width: 1.4mm; Radiation Hardening: No; REACH SVHC: No SVHC; Lead Free: Lead Free; ComponentLink1URL: http://www.diodes.com/_files/datasheets/ZVN3310F.pdf?src-supplier=Digi-Key; ComponentLink1Description: http://www.diodes.com/_files/datasheets/ZVN3310F.pdf?src-supplier=Digi-Key; Supplier Part Number 1: ZVN3310FCT-ND
R2 = RMCF0201FT1K50: RES SMD 1.5K OHM 1% 1/20W 0201; Manufacturer: Stackpole Electronics; Resistance: 1.5kR; Max Power Dissipation: 50mW; Temperature Coefficient: 200ppm/°C; Supplier 1: Digi-Key; Manufacturer Part Number: RMCF0201FT1K50; RoHS: Yes; Category: Chip SMD Resistors; Stock 1: 151457; Pricing 1: 1=0.10000, 10=0.02700, 100=0.01090, 1000=0.00488, 2500=0.00423, 5000=0.00350 (USD); Mount: Surface Mount; Case/Package: 0201; Case Code (Metric): 0603; Case Code (Imperial): 0201; Contact Plating: Tin,Matte; Min Operating Temperature: -55°C; Max Operating Temperature: 125°C; Packaging: Tape and Reel; Tolerance: 1%; Resistor Type: Thick Film; Number of Terminations: 2; Series: RMCF; Length: 0.024inch; Width: 0.012inch; Height: 0.009inch; Radiation Hardening: No; RoHS Compliant: Yes; ComponentLink1URL: https://www.seielect.com/Catalog/SEI-RMCF_RMCP.pdf?src-supplier=Digi-Key; ComponentLink1Description: https://www.seielect.com/Catalog/SEI-RMCF_RMCP.pdf?src-supplier=Digi-Key; ComponentLink2URL: https://www.seielect.com/catalog/SEI-Packaging.pdf?src-supplier=Digi-Key; ComponentLink2Description: https://www.seielect.com/catalog/SEI-Packaging.pdf?src-supplier=Digi-Key; ComponentLink3URL: https://www.seielect.com/catalog/SEI-RMCF_RMCP.pdf?src-supplier=Avnet; ComponentLink3Description: https://www.seielect.com/catalog/SEI-RMCF_RMCP.pdf?src-supplier=Avnet; Supplier Part Number 1: RMCF0201FT1K50CT-ND
R11 R12 R15-R17 = RK73B1ETTP103J: RES 10K OHM 5% 1/10W 0402; Manufacturer: KOA Speer; Resistance: 10kR; Power Rating: 63mW; Voltage Rating: 50V; Temperature Coefficient: 200ppm/°C; Supplier 1: Digi-Key; Manufacturer Part Number: RK73B1ETTP103J; Stock 1: 2917894; Pricing 1: 1=0.1, 10=0.016, 100=0.0065, 1000=0.00292, 2500=0.00253, 5000=0.00209 (USD); Mount: Surface Mount; Case/Package: 0402; Case Code (Imperial): 0402; Case Code (Metric): 1005; Min Operating Temperature: -55°C; Max Operating Temperature: 155°C; Packaging: Tape and Reel; Tolerance: 5%; Package Quantity: 10000; Composition: Thick Film; Termination: SMD/SMT; Military Standard: Not; Voltage Rating (DC): 50V; Length: 1mm; Height: 0.35mm; Width: 0.5mm; Depth: 0.5mm; Lead Free: Lead Free; ComponentLink1URL: https://www.verical.com/server-webapp/html/getDatasheet?partID=89073&src-supplier=Verical; ComponentLink1Description: https://www.verical.com/server-webapp/html/getDatasheet?partID=89073&src-supplier=Verical; Supplier Part Number 1: 2019-RK73B1ETTP103JCT-ND
R13 = RC0402FR-07133KL: RES SMD 133K OHM 1% 1/16W 0402; Manufacturer: Yageo; Resistance: 133kR; Power Rating: 62.5mW; Voltage Rating: 50V; Temperature Coefficient: 100ppm/°C; Max Power Dissipation: 63mW; ComponentLink1URL: http://www.yageo.com/documents/recent/PYu-RC_Group_51_RoHS_L_10.pdf?src-supplier=Digi-Key; ComponentLink1Description: http://www.yageo.com/documents/recent/PYu-RC_Group_51_RoHS_L_10.pdf?src-supplier=Digi-Key; ComponentLink2URL: http://www.yageo.com/documents/recent/PYu-RC_Group_51_RoHS_L_9.pdf?src-supplier=Digi-Key; ComponentLink2Description: http://www.yageo.com/documents/recent/PYu-RC_Group_51_RoHS_L_9.pdf?src-supplier=Digi-Key; ComponentLink3URL: http://www.mouser.com/catalog/specsheets/RC0603.pdf?src-supplier=Mouser; ComponentLink3Description: http://www.mouser.com/catalog/specsheets/RC0603.pdf?src-supplier=Mouser; Supplier 1: Digi-Key; Manufacturer Part Number: RC0402FR-07133KL; Stock 1: 328; Pricing 1: 1=0.1, 10=0.016, 100=0.0064, 1000=0.0029, 2500=0.0025, 5000=0.0021 (USD); Case/Package: 0402; Weight: 2.3E-05oz; Case Code (Imperial): 0402; Case Code (Metric): 1005; Contact Plating: Tin,Matte; Min Operating Temperature: -55°C; Max Operating Temperature: 155°C; Tolerance: 1%; Packaging: Tape and Reel; Composition: Thick Film; Termination: SMD/SMT; Number of Terminations: 2; Military Standard: Not; Voltage Rating (DC): 50V; Working Voltage: 50V; Features: Moisture Resistant; Length: 1mm; Height: 0.016inch; Width: 0.5mm; Depth: 0.5mm; Lead Free: Lead Free; ComponentLink4URL: http://www.yageo.com/documents/recent/PYu-RC_Group_51_RoHS_L_8.pdf?src-supplier=Future+Electronics; ComponentLink4Description: http://www.yageo.com/documents/recent/PYu-RC_Group_51_RoHS_L_8.pdf?src-supplier=Future+Electronics; ComponentLink5URL: http://www.yageo.com/documents/recent/PYu-RC0402_51_RoHS_L_6.pdf?src-supplier=Avnet; ComponentLink5Description: http://www.yageo.com/documents/recent/PYu-RC0402_51_RoHS_L_6.pdf?src-supplier=Avnet; Supplier Part Number 1: YAG2970CT-ND
R14 = RK73H1ETTP4992F: RES 49.9K OHM 1% 1/10W 0402; Manufacturer: KOA Speer; Resistance: 49.9kR; Power Rating: 63mW; Voltage Rating: 50V; Temperature Coefficient: 100ppm/°C; Supplier 1: Digi-Key; Manufacturer Part Number: RK73H1ETTP4992F; Stock 1: 158829; Pricing 1: 1=0.1, 10=0.024, 100=0.0097, 1000=0.00437, 2500=0.0038, 5000=0.00314 (USD); Case/Package: 0402; Case Code (Imperial): 0402; Case Code (Metric): 1005; Min Operating Temperature: -55°C; Max Operating Temperature: 155°C; Tolerance: 1%; Packaging: Tape and Reel; Package Quantity: 10000; Composition: Thick Film; Termination: SMD/SMT; Working Voltage: 50V; Military Standard: Not; Voltage Rating (DC): 50V; Length: 1mm; Height: 0.35mm; Width: 0.5mm; Depth: 0.5mm; Lead Free: Lead Free; ComponentLink1URL: http://www.jameco.com/Jameco/Products/ProdDS/1883861.pdf?src-supplier=Jameco; ComponentLink1Description: http://www.jameco.com/Jameco/Products/ProdDS/1883861.pdf?src-supplier=Jameco; ComponentLink2URL: http://components.arrow.com/part/dataview/39721535S7077293N5146?src-supplier=Arrow; ComponentLink2Description: http://components.arrow.com/part/dataview/39721535S7077293N5146?src-supplier=Arrow; ComponentLink3URL: http://www.koaspeer.com/catimages/Products/RK73H/RK73H.pdf?src-supplier=Mouser; ComponentLink3Description: http://www.koaspeer.com/catimages/Products/RK73H/RK73H.pdf?src-supplier=Mouser; Supplier Part Number 1: 2019-RK73H1ETTP4992FCT-ND
R18 R19 = RC0402JR-070RL: RES SMD 0 OHM JUMPER 1/16W 0402; Manufacturer: Yageo; Manufacturer Part Number: RC0402FR-070RL; Resistance: 0mR; Tolerance: 1%; Power Rating: 62.5mW; Voltage Rating: 50V; Temperature Coefficient: 200ppm/°C; Supplier 1: Digi-Key; Stock 1: 3681314; Pricing 1: 1=0.1, 10=0.013, 25=0.0092, 50=0.0072, 100=0.0053, 250=0.004, 500=0.0032, 1000=0.00236, 5000=0.00169 (USD); Mount: Surface Mount; Case/Package: 0402; Contact Plating: Tin,Matte; Case Code (Imperial): 0402; Case Code (Metric): 1005; Min Operating Temperature: -55°C; Max Operating Temperature: 155°C; Composition: Thick Film; Packaging: Tape and Reel; Termination: SMD/SMT; Length: 1mm; Height: 0.35mm; Width: 0.5mm; Radiation Hardening: No; Lead Free: Lead Free; ComponentLink1URL: http://www.yageo.com/documents/recent/PYu-RC0402_51_RoHS_L_6.pdf?src-supplier=Avnet; ComponentLink1Description: http://www.yageo.com/documents/recent/PYu-RC0402_51_RoHS_L_6.pdf?src-supplier=Avnet; ComponentLink2URL: http://www.yageo.com/documents/recent/PYu-RC0402_51_RoHS_L_6_r.pdf?src-supplier=Future+Electronics; ComponentLink2Description: http://www.yageo.com/documents/recent/PYu-RC0402_51_RoHS_L_6_r.pdf?src-supplier=Future+Electronics; ComponentLink3URL: http://www.yageo.com/documents/recent/PYu-RC0402_51_RoHS_L_6.pdf?src-supplier=Avnet+Europe; ComponentLink3Description: http://www.yageo.com/documents/recent/PYu-RC0402_51_RoHS_L_6.pdf?src-supplier=Avnet+Europe; Supplier Part Number 1: 311-0.0LRCT-ND
R20 = RC0402JR-0720KL: RES SMD 20K OHM 5% 1/16W 0402; Manufacturer: Yageo; Resistance: 20kR; Power Rating: 62.5mW; Voltage Rating: 50V; Temperature Coefficient: 100ppm/°C; Max Power Dissipation: 63mW; Supplier 1: Digi-Key; Manufacturer Part Number: RC0402JR-0720KL; Stock 1: 4817510; Pricing 1: 1=0.1, 10=0.013, 100=0.0053, 1000=0.00236, 2500=0.00205, 5000=0.00169 (USD); Case/Package: 0402; Number of Pins: 2; Case Code (Metric): 1005; Case Code (Imperial): 0402; Min Operating Temperature: -55°C; Max Operating Temperature: 155°C; Package Quantity: 1; Tolerance: 5%; Packaging: Tape and Reel; Composition: Thick Film; Number of Terminations: 2; Termination: SMD/SMT; Military Standard: Not; Voltage Rating (DC): 50V; Features: Moisture Resistant; Length: 0.039inch; Height: 0.016inch; Width: 0.02inch; Depth: 0.5mm; REACH SVHC: No SVHC; Lead Free: Lead Free; ComponentLink1URL: http://www.yageo.com/documents/recent/PYu-RC_Group_51_RoHS_L_9.pdf?src-supplier=Digi-Key; ComponentLink1Description: http://www.yageo.com/documents/recent/PYu-RC_Group_51_RoHS_L_9.pdf?src-supplier=Digi-Key; ComponentLink2URL: http://www.farnell.com/datasheets/1018594.pdf?src-supplier=Element14; ComponentLink2Description: http://www.farnell.com/datasheets/1018594.pdf?src-supplier=Element14; ComponentLink3URL: http://www.mouser.com/ds/2/447/PYu-RC0402_51_RoHS_L_6_r-8721.pdf?src-supplier=Mouser; ComponentLink3Description: http://www.mouser.com/ds/2/447/PYu-RC0402_51_RoHS_L_6_r-8721.pdf?src-supplier=Mouser; ComponentLink4URL: http://www.yageo.com/documents/recent/PYu-RC0402_51_RoHS_L_6_r.pdf?src-supplier=Future+Electronics; ComponentLink4Description: http://www.yageo.com/documents/recent/PYu-RC0402_51_RoHS_L_6_r.pdf?src-supplier=Future+Electronics; Supplier Part Number 1: 311-20KJRCT-ND
RF5 = AC0402FR-07118KL: RES SMD 118K OHM 1% 1/16W 0402; Manufacturer: Yageo; Resistance: 118kR; Max Power Dissipation: 63mW; Temperature Coefficient: 100ppm/°C; Supplier 1: Digi-Key; Manufacturer Part Number: AC0402FR-07118KL; Stock 1: 0; Pricing 1: 10000=0.0022 (USD); Case/Package: 0402; Min Operating Temperature: -55°C; Max Operating Temperature: 155°C; Packaging: Tape and Reel; Composition: Thick Film; Number of Terminations: 2; Tolerance: 1%; Features: Moisture Resistant,Automotive AEC-Q200; Length: 0.039inch; Height: 0.015inch; Width: 0.02inch; ComponentLink1URL: http://www.yageo.com/NewPortal/yageodocoutput?fileName=/pdf/R-Chip/PYu-AC_51_RoHS_L_6.pdf&src-supplier=Digi-Key; ComponentLink1Description: http://www.yageo.com/NewPortal/yageodocoutput?fileName=/pdf/R-Chip/PYu-AC_51_RoHS_L_6.pdf&src-supplier=Digi-Key; Supplier Part Number 1: AC0402FR-07118KL-ND
RF6 = RC0402FR-0713K3L: RES SMD 13.3K OHM 1% 1/16W 0402; Manufacturer: Yageo; Resistance: 13.3kR; Temperature Coefficient: 100ppm/°C; Power Rating: 62.5mW; Voltage Rating: 50V; Max Power Dissipation: 63mW; Supplier 1: Digi-Key; Manufacturer Part Number: RC0402FR-0713K3L; Stock 1: 459115; Pricing 1: 1=0.1, 10=0.016, 100=0.0064, 1000=0.00289, 2500=0.00251, 5000=0.00207 (USD); Case/Package: 0402; Contact Plating: Tin,Matte; Case Code (Imperial): 0402; Case Code (Metric): 1005; Min Operating Temperature: -55°C; Max Operating Temperature: 155°C; Tolerance: 1%; Composition: Thick Film; Packaging: Tape and Reel; Number of Terminations: 2; Termination: SMD/SMT; Military Standard: Not; Voltage Rating (DC): 50V; Working Voltage: 50V; Features: Moisture Resistant; Length: 1mm; Height: 0.016inch; Width: 0.02inch; Depth: 0.5mm; Lead Free: Lead Free; ComponentLink1URL: http://www.yageo.com/documents/recent/PYu-RC0402_51_RoHS_L_6.pdf?src-supplier=Avnet+Europe; ComponentLink1Description: http://www.yageo.com/documents/recent/PYu-RC0402_51_RoHS_L_6.pdf?src-supplier=Avnet+Europe; ComponentLink2URL: http://www.yageo.com/documents/recent/PYu-RC0402_51_RoHS_L_6_r.pdf?src-supplier=Future+Electronics; ComponentLink2Description: http://www.yageo.com/documents/recent/PYu-RC0402_51_RoHS_L_6_r.pdf?src-supplier=Future+Electronics; ComponentLink3URL: http://www.mouser.com/ds/2/447/PYu-RC0402_51_RoHS_L_6_r-8721.pdf?src-supplier=Mouser; ComponentLink3Description: http://www.mouser.com/ds/2/447/PYu-RC0402_51_RoHS_L_6_r-8721.pdf?src-supplier=Mouser; Supplier Part Number 1: YAG2974CT-ND
RZ1 = RC0402FR-0747KL: RES SMD 47K OHM 1% 1/16W 0402; Manufacturer: Yageo; Power Rating: 62.5mW; Temperature Coefficient: 100ppm/°C; Voltage Rating: 50V; Resistance: 47kR; Max Power Dissipation: 63mW; Supplier 1: Digi-Key; Manufacturer Part Number: RC0402FR-0747KL; Stock 1: 0; Pricing 1: 1=0.1, 10=0.016, 100=0.0064, 1000=0.00289, 2500=0.00251, 5000=0.00207 (USD); Case/Package: 0402; Case Code (Imperial): 0402; Case Code (Metric): 1005; Min Operating Temperature: -55°C; Max Operating Temperature: 155°C; Tolerance: 1%; Packaging: Tape and Reel; Package Quantity: 1; Termination: SMD/SMT; Composition: Thick Film; Number of Terminations: 2; Military Standard: Not; Features: Moisture Resistant; Length: 1mm; Height: 0.016inch; Depth: 0.5mm; Width: 0.5mm; REACH SVHC: Unknown; Lead Free: Lead Free; ComponentLink1URL: http://www.yageo.com/documents/recent/PYu-RC0402_51_RoHS_L_6_r.pdf?src-supplier=Future+Electronics; ComponentLink1Description: http://www.yageo.com/documents/recent/PYu-RC0402_51_RoHS_L_6_r.pdf?src-supplier=Future+Electronics; ComponentLink2URL: http://www.farnell.com/datasheets/1018594.pdf?src-supplier=Element14; ComponentLink2Description: http://www.farnell.com/datasheets/1018594.pdf?src-supplier=Element14; ComponentLink3URL: https://www.verical.com/server-webapp/html/getDatasheet?partID=323748&src-supplier=Verical; ComponentLink3Description: https://www.verical.com/server-webapp/html/getDatasheet?partID=323748&src-supplier=Verical; ComponentLink4URL: http://www.yageo.com/documents/recent/PYu-RC_Group_51_RoHS_L_10.pdf?src-supplier=Digi-Key; ComponentLink4Description: http://www.yageo.com/documents/recent/PYu-RC_Group_51_RoHS_L_10.pdf?src-supplier=Digi-Key; Supplier Part Number 1: 311-47.0KLRDKR-ND
SB3 SB_ZD1 = Solder Bridge: Solder Bridge ON
U7 = DRV8876PWPR: IC MOTOR DRIVER DC 5.5V 16HTSSOP; Manufacturer: Texas Instruments; Supplier 1: Digi-Key; Manufacturer Part Number: DRV8876PWPR; RoHS: Yes; Category: Motor Drivers; Pricing 1: 1=2.40000, 10=2.15700, 25=2.03520, 100=1.73400, 250=1.62816, 500=1.42464, 1000=1.34400 (USD); Supplier Part Number 1: 296-53515-6-ND
U8 = MCP7940N-I/SN: IC RTC CLK/CALENDAR I2C 8-SOIC; Manufacturer: Microchip; Logic Function: Clock; Time Format: HH:MM:SS; Min Supply Voltage: 1.8V; Max Supply Voltage: 5.5V; Memory Size: 64B; Max Frequency: 400kHz; Supplier 1: Digi-Key; Manufacturer Part Number: MCP7940N-I/SN; Stock 1: 4875; Pricing 1: 1=0.74, 25=0.68, 100=0.65 (USD); Mount: Surface Mount; Case/Package: SOIC; Number of Pins: 8; Contact Plating: Tin,Matte; Min Operating Temperature: -40°C; Max Operating Temperature: 85°C; Interface: I2C; Packaging: Rail/Tube; Package Quantity: 100; Length: 4.9mm; Height: 1.5mm; Width: 3.9mm; Radiation Hardening: No; REACH SVHC: No SVHC; Lead Free: Lead Free; ComponentLink1URL: http://www.microchip.com/mymicrochip/filehandler.aspx?ddocname=en569228&src-supplier=Digi-Key; ComponentLink1Description: http://www.microchip.com/mymicrochip/filehandler.aspx?ddocname=en569228&src-supplier=Digi-Key; ComponentLink2URL: http://www.farnell.com/datasheets/2129560.pdf?src-supplier=Mouser; ComponentLink2Description: http://www.farnell.com/datasheets/2129560.pdf?src-supplier=Mouser; ComponentLink3URL: http://www.microchip.com/mymicrochip/filehandler.aspx?ddocname=en553487&src-supplier=Future+Electronics; ComponentLink3Description: http://www.microchip.com/mymicrochip/filehandler.aspx?ddocname=en553487&src-supplier=Future+Electronics; ComponentLink4URL: http://www.farnell.com/datasheets/2129560.pdf?src-supplier=Avnet+Europe; ComponentLink4Description: http://www.farnell.com/datasheets/2129560.pdf?src-supplier=Avnet+Europe; ComponentLink5URL: http://www.farnell.com/datasheets/2129560.pdf?src-supplier=Avnet; ComponentLink5Description: http://www.farnell.com/datasheets/2129560.pdf?src-supplier=Avnet; Supplier Part Number 1: MCP7940N-I/SN-ND
UF2 = LMR62014XMF/NOPB: IC REG BOOST ADJ 2A SOT23-5; Manufacturer: TI National Semiconductor; Max Output Current: 1.4A; Min Input Voltage: 2.7V; Max Input Voltage: 14V; Number of Outputs: 1; Output Voltage: 20V; Switching Frequency: 1.6MHz; Min Output Voltage: 3V; Synchronous Rectifier: No; Quiescent Current: 2mA; Output Type: Adjustable; Output Configuration: Positive; Supplier 1: Digi-Key; Manufacturer Part Number: LMR62014XMF/NOPB; Stock 1: 74950; Pricing 1: 1=1.6, 10=1.428, 25=1.3552, 100=1.0406, 250=0.9196, 500=0.8712 (USD); Mount: Surface Mount; Case/Package: SOT-23-5; Number of Pins: 5; Contact Plating: Tin,Matte; Min Operating Temperature: -40°C; Max Operating Temperature: 125°C; Output Current: 1.4A; Packaging: Tape and Reel; Package Quantity: 1000; Max Output Voltage: 20V; Topology: Boost; Radiation Hardening: No; REACH SVHC: No SVHC; Lead Free: Lead Free; ComponentLink1URL: http://www.ti.com/general/docs/lit/getliterature.tsp?genericPartNumber=LMR62014&&fileType=pdf&src-supplier=Avnet; ComponentLink1Description: http://www.ti.com/general/docs/lit/getliterature.tsp?genericPartNumber=LMR62014&&fileType=pdf&src-supplier=Avnet; ComponentLink2URL: http://www.ti.com/lit/gpn/lmr62014?src-supplier=Mouser; ComponentLink2Description: http://www.ti.com/lit/gpn/lmr62014?src-supplier=Mouser; ComponentLink3URL: http://www.farnell.com/datasheets/1882593.pdf?src-supplier=Element14; ComponentLink3Description: http://www.farnell.com/datasheets/1882593.pdf?src-supplier=Element14; ComponentLink4URL: http://www.ti.com/lit/ds/symlink/lmr62014.pdf?src-supplier=Digi-Key; ComponentLink4Description: http://www.ti.com/lit/ds/symlink/lmr62014.pdf?src-supplier=Digi-Key; Supplier Part Number 1: LMR62014XMF/NOPBCT-ND
X2 = NX3215SA-32.768K-STD-MUA-8: CRYSTAL 32.7680KHZ 12.5PF SMD; Manufacturer: NDK; Frequency: 32.768kHz; Frequency Tolerance: 20ppm; ESR (Equivalent Series Resistance): 70kR; Supplier 1: Digi-Key; Manufacturer Part Number: NX3215SA-32.768K-STD-MUA-8; Stock 1: 29951; Pricing 1: 1=0.68, 10=0.602, 50=0.5628, 100=0.4974, 500=0.47124, 1000=0.3927 (USD); Mount: Surface Mount; Case/Package: SMD/SMT; Number of Pins: 2; Min Operating Temperature: -40°C; Max Operating Temperature: 85°C; Package Quantity: 1000; Load Capacitance: 12.5pF; Packaging: Tape and Reel; Length: 0.126inch; Height: 0.035inch; Width: 0.059inch; Lead Free: Lead Free; ComponentLink1URL: https://media.digikey.com/pdf/Data%20Sheets/NDK%20PDFs/NX3215SA-32.768K-STD-MUA-8.pdf?src-supplier=Digi-Key; ComponentLink1Description: https://media.digikey.com/pdf/Data%20Sheets/NDK%20PDFs/NX3215SA-32.768K-STD-MUA-8.pdf?src-supplier=Digi-Key; ComponentLink2URL: http://www.ndk.com/images/products/catalog/c_NX3215SA-STD-MUA-14_e.pdf?src-supplier=Digi-Key; ComponentLink2Description: http://www.ndk.com/images/products/catalog/c_NX3215SA-STD-MUA-14_e.pdf?src-supplier=Digi-Key; Supplier Part Number 1: 644-1156-6-ND